# Altium schematic sheet USB_Male_Sheet.SchDoc
size A4; SheetNumber: 1; SheetTotal: 1
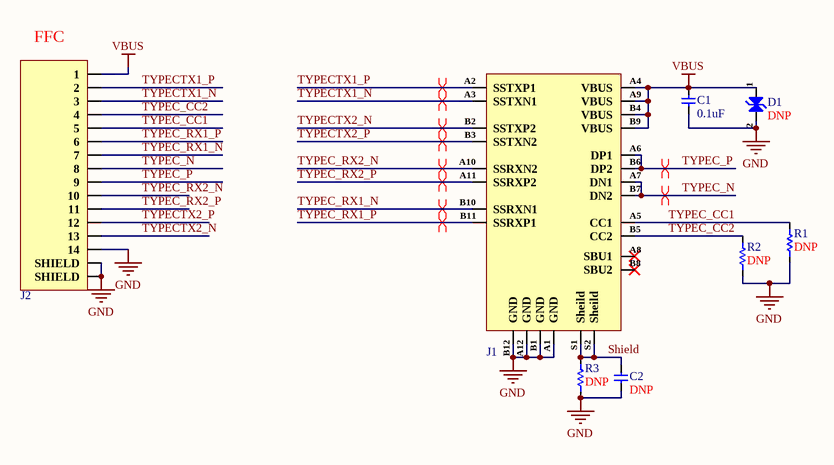
[diagram p0: USB_Male_Sheet.SchDoc]

## Parts
C1  0.1uF  [CAP-0201]
C2  DNP  [CAP-0201]
D1  DNP  [DFN1006-2L (Bi-Directional)]
J1  USB4155-03-C  [USB4155-03-C]  (value not drawn)
J2  5051101492  [5051101492]  (value not drawn)
R1  DNP  [Res-0201]
R2  DNP  [Res-0201]
R3  DNP  [Res-0201]

## Nets
GND: C1.2 C2.1 D1.2(K) J1.A1(GND) J1.A12(GND) J1.B1(GND) J1.B12(GND) J2.14 J2.S1(SHIELD) J2.S2(SHIELD) R1.1 R2.1 R3.1
VBUS: C1.1 D1.1(K) J1.A4(VBUS) J1.A9(VBUS) J1.B4(VBUS) J1.B9(VBUS) J2.1
Shield: C2.2 J1.S1(Sheild) J1.S2(Sheild) R3.2
TYPEC_CC1: J1.A5(CC1) J2.5 R1.2
TYPEC_CC2: J1.B5(CC2) J2.4 R2.2
TYPEC_N: J1.A7(DN1) J1.B7(DN2) J2.8
TYPEC_P: J1.A6(DP1) J1.B6(DP2) J2.9
TYPEC_RX1_N: J1.B10(SSRXN1) J2.7
TYPEC_RX1_P: J1.B11(SSRXP1) J2.6
TYPEC_RX2_N: J1.A10(SSRXN2) J2.10
TYPEC_RX2_P: J1.A11(SSRXP2) J2.11
TYPECTX1_N: J1.A3(SSTXN1) J2.3
TYPECTX1_P: J1.A2(SSTXP1) J2.2
TYPECTX2_N: J1.B2(SSTXP2) J2.13
TYPECTX2_P: J1.B3(SSTXN2) J2.12

Not connected (* = marked no-connect by the designer): J1 A8(SBU1)* B8(SBU2)*

## Layout directives
differential pair; differential pair class USB: TYPEC_N, TYPEC_P, TYPEC_RX1_N, TYPEC_RX1_P, TYPEC_RX2_N, TYPEC_RX2_P, TYPECTX1_N, TYPECTX1_P, TYPECTX2_N, TYPECTX2_P

## Notes on the sheet
- (near J2) FFC
- File:
- Title:
- Date:
- Page
- Num:
- Total:
- Drawn By: Huzaifa Ali

## Library data of the parts
C1 = GRM033R61E104ME14D: CAP CER 0.1UF 25V X5R 0201; Manufacturer: Murata; Item Type: Capacitors; Material: 4241ConductorMaterial; Supplier: Future Electronics; LCSC Part Number: C2649557; Manufacturer Part Number: GRM033R61E104ME14D; RoHS: Yes; Stock: 270000; Pricing: 15000=0.0037, 45000=0.0036, 75000=0.0035, 300000=0.0034, 450000=0.0033 (USD); Voltage Rating (DC): 25V; Height: 330um; ComponentLink1URL: https://datasheet.octopart.com/GRM033R61E104ME14D-Murata-datasheet-96224008.pdf?src-supplier=Future+Electronics; ComponentLink1Description: https://datasheet.octopart.com/GRM033R61E104ME14D-Murata-datasheet-96224008.pdf?src-supplier=Future+Electronics; ComponentLink2URL: http://search.murata.co.jp/Ceramy/image/img/A01X/G101/ENG/GRM033R61E104ME14-01.pdf?src-supplier=Digikey; ComponentLink2Description: http://search.murata.co.jp/Ceramy/image/img/A01X/G101/ENG/GRM033R61E104ME14-01.pdf?src-supplier=Digikey; ComponentLink3URL: http://psearch.en.murata.com/capacitor/product/GRM033R61E104ME14%23.pdf?src-supplier=Avnet; ComponentLink3Description: http://psearch.en.murata.com/capacitor/product/GRM033R61E104ME14%23.pdf?src-supplier=Avnet
C2 = GRM033R61E472MA12D: CAP CER 4700PF 25V X5R 0201; Manufacturer: Murata; Item Type: Capacitors; Material: 4241ConductorMaterial; Value: 4.7nF; Tolerance: 20%; Supplier: Mouser; Supplier Part Number: 81-GRM33R61E472MA12D; Manufacturer Part Number: GRM033R61E472MA12D; RoHS: Yes; Stock: 77158; Pricing: 1=0.1, 10=0.008, 50=0.008, 100=0.005, 1000=0.004, 10000=0.004 (USD); Mounting Technology: Surface Mount; Case/Package: 0201; Case Code (Metric): 0603; Case Code (Imperial): 0201; Weight: 1.2E-05oz; Min Operating Temperature: -55°C; Max Operating Temperature: 85°C; Packaging: Tape and Reel; Voltage Rating: 25V; Dielectric: X5R; Termination: SMD/SMT; Voltage Rating (DC): 25V; Package Quantity: 15000; Series: GRM; Length: 0.024inch; Width: 0.012inch; Height: 0.3mm; Thickness: 0.013inch; RoHS Compliant: Yes; ComponentLink1URL: http://www.mouser.com/ds/2/281/c02e-2905.pdf?src-supplier=Mouser; ComponentLink1Description: http://www.mouser.com/ds/2/281/c02e-2905.pdf?src-supplier=Mouser; ComponentLink2URL: http://search.murata.co.jp/Ceramy/image/img/A01X/G101/ENG/GRM033R61E472MA12-01.pdf?src-supplier=Digikey; ComponentLink2Description: http://search.murata.co.jp/Ceramy/image/img/A01X/G101/ENG/GRM033R61E472MA12-01.pdf?src-supplier=Digikey; ComponentLink3URL: https://search.murata.co.jp/Ceramy/image/img/A01X/G101/ENG/GRM033R61E472MA12-01.pdf?src-supplier=Digikey; ComponentLink3Description: https://search.murata.co.jp/Ceramy/image/img/A01X/G101/ENG/GRM033R61E472MA12-01.pdf?src-supplier=Digikey
D1 = ESD5451N: DFN1006-2(0402) ESD Protection Devices ROHS; Manufacturer: TECH PUBLIC; Manufacturer Part Number: ESD5451N; Footprint: DFN1006-2(0402); ComponentLink1Description: LCSC; ComponentLink1URL: https://www.lcsc.com/product-detail/span-style-background-color-ff0-ESD-span-Protection-Devices_TECH-PUBLIC-ESD5451N_C2936977.html; LCSC Part Number: C2936977
J1 = USB4155-03-C: USB Connectors USB Type C, Plug, SMT , G/F, Right Angled Mount, T R; Manufacturer: Global Connector Technology; Supplier: Digikey; Supplier Part Number: 2073-USB4155-03-CCT-ND; Manufacturer Part Number: USB4155-03-C; RoHS: No; Category: USB Connectors; Stock: 334; Pricing: 1=1.61, 10=1.371, 25=1.2856, 50=1.224, 100=1.1654, 250=1.0924, 500=1.04024 (USD); ComponentLink1URL: https://datasheet.octopart.com/USB4155-03-C-Global-Connector-Technology-datasheet-169726654.pdf?src-supplier=Future+Electronics; ComponentLink1Description: https://datasheet.octopart.com/USB4155-03-C-Global-Connector-Technology-datasheet-169726654.pdf?src-supplier=Future+Electronics; LCSC Part Number: C5183853; Item Type: Connector
J2 = 5051101492: 14 Position FFC, FPC Connector Contacts, Bottom 0.020" (0.50mm) Surface Mount, Right Angle; Manufacturer: Molex; Manufacturer Part Number: 505110-1492; Supplier: Arrow Electronics; Supplier Part Number: 505110-1492; RoHS: Yes; Category: FFC / FPC; Stock: 9000; Pricing: 9000=0.3633, 15000=0.3615 (USD); ComponentLink1URL: http://www.alliedelec.com/m/d/498d8ef60ec1840486550b3bb04c7a47.pdf?src-supplier=Allied+Electronics; ComponentLink1Description: http://www.alliedelec.com/m/d/498d8ef60ec1840486550b3bb04c7a47.pdf?src-supplier=Allied+Electronics; ComponentLink2URL: https://media.digikey.com/pdf/Data%20Sheets/Molex%20PDFs/FFC-FPC_Connectors.pdf?src-supplier=Digikey; ComponentLink2Description: https://media.digikey.com/pdf/Data%20Sheets/Molex%20PDFs/FFC-FPC_Connectors.pdf?src-supplier=Digikey; ComponentLink3URL: https://datasheet.octopart.com/505110-1492-Molex-datasheet-77521073.pdf?src-supplier=Element14; ComponentLink3Description: https://datasheet.octopart.com/505110-1492-Molex-datasheet-77521073.pdf?src-supplier=Element14; ComponentLink4URL: http://www.farnell.com/datasheets/2014276.pdf?src-supplier=Element14; ComponentLink4Description: http://www.farnell.com/datasheets/2014276.pdf?src-supplier=Element14; ComponentLink5URL: https://www.molex.com/datasheets/rohspdf/5051101492_rohs.pdf?src-supplier=Digikey; ComponentLink5Description: https://www.molex.com/datasheets/rohspdf/5051101492_rohs.pdf?src-supplier=Digikey; ComponentLink6URL: https://datasheet.octopart.com/505110-1492-Molex-datasheet-62088043.pdf?src-supplier=Farnell; ComponentLink6Description: https://datasheet.octopart.com/505110-1492-Molex-datasheet-62088043.pdf?src-supplier=Farnell; ComponentLink7URL: https://datasheet.octopart.com/505110-1492-Molex-datasheet-134576216.pdf?src-supplier=TME; ComponentLink7Description: https://datasheet.octopart.com/505110-1492-Molex-datasheet-134576216.pdf?src-supplier=TME; ComponentLink8URL: https://datasheet.octopart.com/505110-1492-Molex-datasheet-154754609.pdf?src-supplier=Master+Electronics; ComponentLink8Description: https://datasheet.octopart.com/505110-1492-Molex-datasheet-154754609.pdf?src-supplier=Master+Electronics; LCSC Part Number: C3169593; Item Type: Connector
R1 R2 = RC0201FR-075K1L: RES 5.1K OHM 1% 1/20W 0201; Manufacturer: Yageo; Power Rating: 50mW; Value: 5.1kR; Voltage Rating: 25V; Temperature Coefficient: 200ppm/°C; Item Type: Resistor; Supplier: Future Electronics; Supplier Part Number: 9072847; Manufacturer Part Number: RC0201FR-075K1L; RoHS: Yes; Category: Chip SMD Resistors; Stock: 280000; Pricing: 10000=0.0014, 40000=0.0013, 200000=0.0013, 400000=0.0012, 1250000=0.0011 (USD); Case/Package: 0201; Case Code (Imperial): 0201; Case Code (Metric): 0603; Min Operating Temperature: -55°C; Max Operating Temperature: 125°C; Packaging: Tape and Reel; Tolerance: 1%; Termination: SMD/SMT; Number of Terminations: 2; Max Power Dissipation: 50mW; Features: Moisture Resistant; Series: RC; Length: 0.6mm; Width: 0.3mm; Height: 0.23mm; Lead Free: Lead Free; RoHS Compliant: Yes; ComponentLink1URL: http://www.mouser.com/ds/2/447/RC0201-559633.pdf?src-supplier=Mouser; ComponentLink1Description: http://www.mouser.com/ds/2/447/RC0201-559633.pdf?src-supplier=Mouser; ComponentLink2URL: https://datasheet.octopart.com/RC0201FR-075K1L-Yageo-datasheet-164759695.pdf?src-supplier=Future+Electronics; ComponentLink2Description: https://datasheet.octopart.com/RC0201FR-075K1L-Yageo-datasheet-164759695.pdf?src-supplier=Future+Electronics; ComponentLink3URL: http://www.yageo.com/documents/recent/PYu-RC_Group_51_RoHS_L_10.pdf?src-supplier=Digi-Key; ComponentLink3Description: http://www.yageo.com/documents/recent/PYu-RC_Group_51_RoHS_L_10.pdf?src-supplier=Digi-Key; LCSC Part Number: C274341
R3 = RC0201FR-071ML: RES 1M OHM 1% 1/20W 0201; Manufacturer: Yageo; Item Type: Resistor; Value: 1MR; Temperature Coefficient: 200ppm/°C; Power Rating: 50mW; Voltage Rating: 25V; Supplier: Avnet; LCSC Part Number: C295786; Manufacturer Part Number: RC0201FR-071ML; RoHS: Yes; Stock: 13025; Pricing: 1=0.104, 25=0.016, 100=0.008, 250=0.007, 1000=0.006 (USD); Case/Package: 0201; Contact Plating: Tin,Matte; Case Code (Imperial): 0201; Case Code (Metric): 0603; Min Operating Temperature: -55°C; Max Operating Temperature: 125°C; Tolerance: 1%; Resistor Type: Thick Film; Packaging: Tape and Reel; Package Quantity: 10000; Termination: SMD/SMT; Number of Terminations: 2; Max Power Dissipation: 50mW; Features: Moisture Resistant; Series: RC; Resistance Tolerance: 1%; Construction: Rectangular; Voltage Rating (DC): 25V; Length: 0.6mm; Width: 0.3mm; Height: 0.01inch; Depth: 0.3mm; Military Standard: Not; RoHS Compliant: Yes; Reach SVHC Compliant: Unknown; Lead Free: 5697LeadFree; ComponentLink1URL: https://datasheet.ciiva.com/29721/pyu-r-int-thick-7-29721005.pdf?src-supplier=Digikey; ComponentLink1Description: https://datasheet.ciiva.com/29721/pyu-r-int-thick-7-29721005.pdf?src-supplier=Digikey; ComponentLink2URL: https://datasheet.ciiva.com/29721/pyu-r-int-thick-7-29721006.pdf?src-supplier=Digikey; ComponentLink2Description: https://datasheet.ciiva.com/29721/pyu-r-int-thick-7-29721006.pdf?src-supplier=Digikey; ComponentLink3URL: https://datasheet.ciiva.com/7672/1563626-7672207.pdf?src-supplier=Element14; ComponentLink3Description: https://datasheet.ciiva.com/7672/1563626-7672207.pdf?src-supplier=Element14; ComponentLink4URL: https://datasheet.ciiva.com/22698/1563626-22698507.pdf?src-supplier=Element14; ComponentLink4Description: https://datasheet.ciiva.com/22698/1563626-22698507.pdf?src-supplier=Element14; ComponentLink5URL: https://datasheet.ciiva.com/25647/pyu-r-int-thick-7-25647311.pdf?src-supplier=Digikey; ComponentLink5Description: https://datasheet.ciiva.com/25647/pyu-r-int-thick-7-25647311.pdf?src-supplier=Digikey